# Altium schematic sheet usb_uart_ESP32P4.SchDoc
size A; SheetNumber: 4; SheetTotal: 7
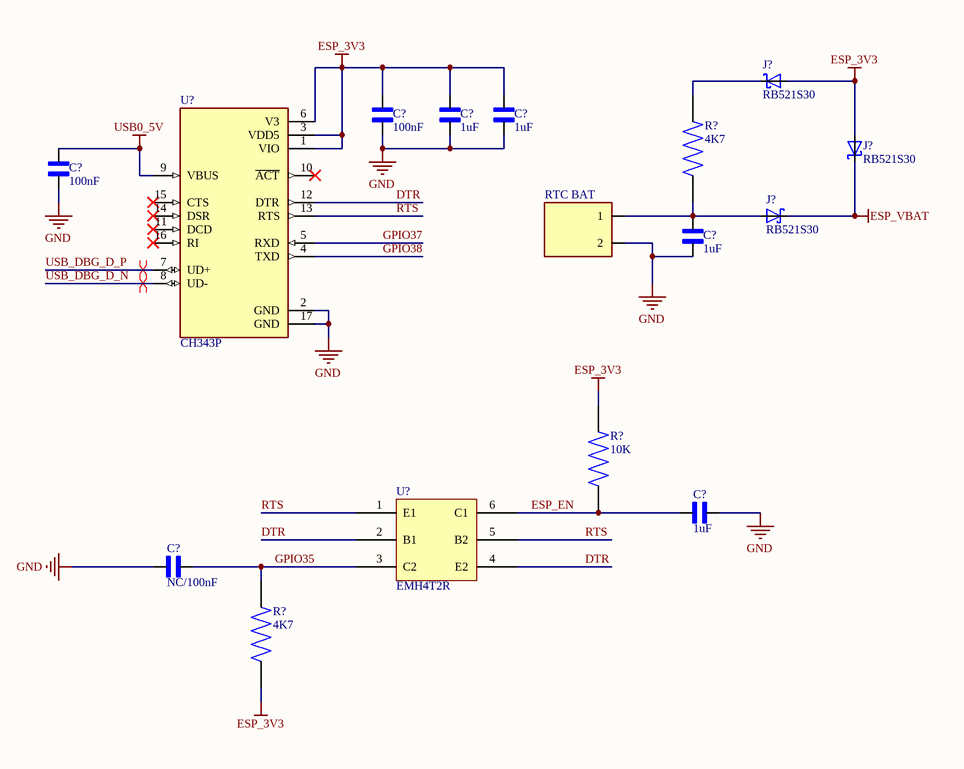
[diagram p0: usb_uart_ESP32P4.SchDoc]

## Parts
(Parts that share a designator on the sheet are numbered #1, #2 ... from top to bottom, then left to right.)
C?#1  100nF  [CAPC1005X61N]
C?#2  1uF  [CAPC1005X61N]
C?#3  1uF  [CAPC1005X61N]
C?#4  100nF  [CAPC1005X61N]
C?#5  1uF  [CAPC1005X61N]
C?#6  1uF  [CAPC1005X61N]
C?#7  NC/100nF  [CAPC1005X61N]
J?#1  RB521S30  [SOD523]
J?#2  RB521S30  [SOD523]
J?#3  RB521S30  [SOD523]
R?#1  4K7  [RES_ERJU02F5102X]
R?#2  10K  [RES_ERJU02F5102X]
R?#3  4K7  [RES_ERJU02F5102X]
RTC_BAT  B2B-PH-SM4-TB(LF)(SN)  [SM4-CON]  (value not drawn)
U?#1  CH343P  [QFN50P300X300X80-17N]
U?#2  EMH4T2R  [SOT50P160X55-6N]

## Nets
ESP_3V3: C?#1.2 C?#2.2 C?#3.2 J?#1.2(A) J?#2.2(A) R?#2.2 R?#3.1 U?#1.1(VIO) U?#1.3(VDD5) U?#1.6(V3)
ESP_VBAT: J?#2.1(K) J?#3.1(K)
GND: C?#1.1 C?#2.1 C?#3.1 C?#4.1 C?#5.1 C?#6.1 C?#7.2 RTC_BAT.2 U?#1.2(GND) U?#1.17(GND)
USB0_5V: C?#4.2 U?#1.9(VBUS)
DTR: U?#1.12(DTR) U?#2.2(B1) U?#2.4(E2)
ESP_EN: C?#6.2 R?#2.1 U?#2.6(C1)
GPIO35: C?#7.1 R?#3.2 U?#2.3(C2)
GPIO37: U?#1.5(RXD)
GPIO38: U?#1.4(TXD)
RTS: U?#1.13(RTS) U?#2.1(E1) U?#2.5(B2)
USB_DBG_D_N: U?#1.8(UD-)
USB_DBG_D_P: U?#1.7(UD+)
NetC?#5_2: C?#5.2 J?#3.2(A) R?#1.1 RTC_BAT.1
NetJ?#1_1: J?#1.1(K) R?#1.2

Not connected (* = marked no-connect by the designer): U?#1 10(~{ACT})* 11(DCD)* 14(DSR)* 15(CTS)* 16(RI)*

## Layout directives
differential pair: USB_DBG_D_N, USB_DBG_D_P

## Library data of the parts
C?#1-C?#7 = cap_0402_VJ0402D100MXCAP: cap 0402; MF: Vishay Vitramon; SnapEDA_Link: https://www.snapeda.com/parts/VJ0402D100MXCAP/Vishay/view-part/?ref=snap; Package: 1005 Vishay Vitramon; Value: *; MP: VJ0402D100MXCAP; Check_prices: https://www.snapeda.com/parts/VJ0402D100MXCAP/Vishay/view-part/?ref=eda
J?#1-J?#3 = RB521S30: Diode 30 V 200mA Surface Mount SOD-523F; MF: Taiwan Semiconductor; MP: RB521S-30; SnapEDA_Link: https://www.snapeda.com/parts/RB521S-30/taiwan/view-part/?ref=snap; Package: SOD-523F-2 Taiwan Semiconductor; Value: *; Check_prices: https://www.snapeda.com/parts/RB521S-30/taiwan/view-part/?ref=eda
R?#1-R?#3 = res_0402_ERJU02F5102X: Availability: Unavailable; MP: ERJU02F5102X; Price: None; Package: None; Value: *
RTC_BAT = B2B-PH-SM4-TB(LF)(SN): Connector Header Surface Mount 2 position 0.079 (2.00mm); MF: JST Sales; SnapEDA_Link: https://www.snapeda.com/parts/B2B-PH-SM4-TB(LF)(SN)/JST+Sales+America+Inc./view-part/?ref=snap; Package: NON STANDARD-2 JST; Value: *; MP: B2B-PH-SM4-TB(LF)(SN); Check_prices: https://www.snapeda.com/parts/B2B-PH-SM4-TB(LF)(SN)/JST+Sales+America+Inc./view-part/?ref=eda
U?#1 = CH343P: USB to High-Speed Serial Chip CH343; MF: WCH; SnapEDA_Link: https://www.snapeda.com/parts/CH343P/WCH/view-part/?ref=snap; Package: Package; Value: *; MP: CH343P; Check_prices: https://www.snapeda.com/parts/CH343P/WCH/view-part/?ref=eda
U?#2 = EMH4T2R: Dual NPN digital transistor with built-in bias resistors, 50V, 100mA, SOT-563 (EMT6) package.